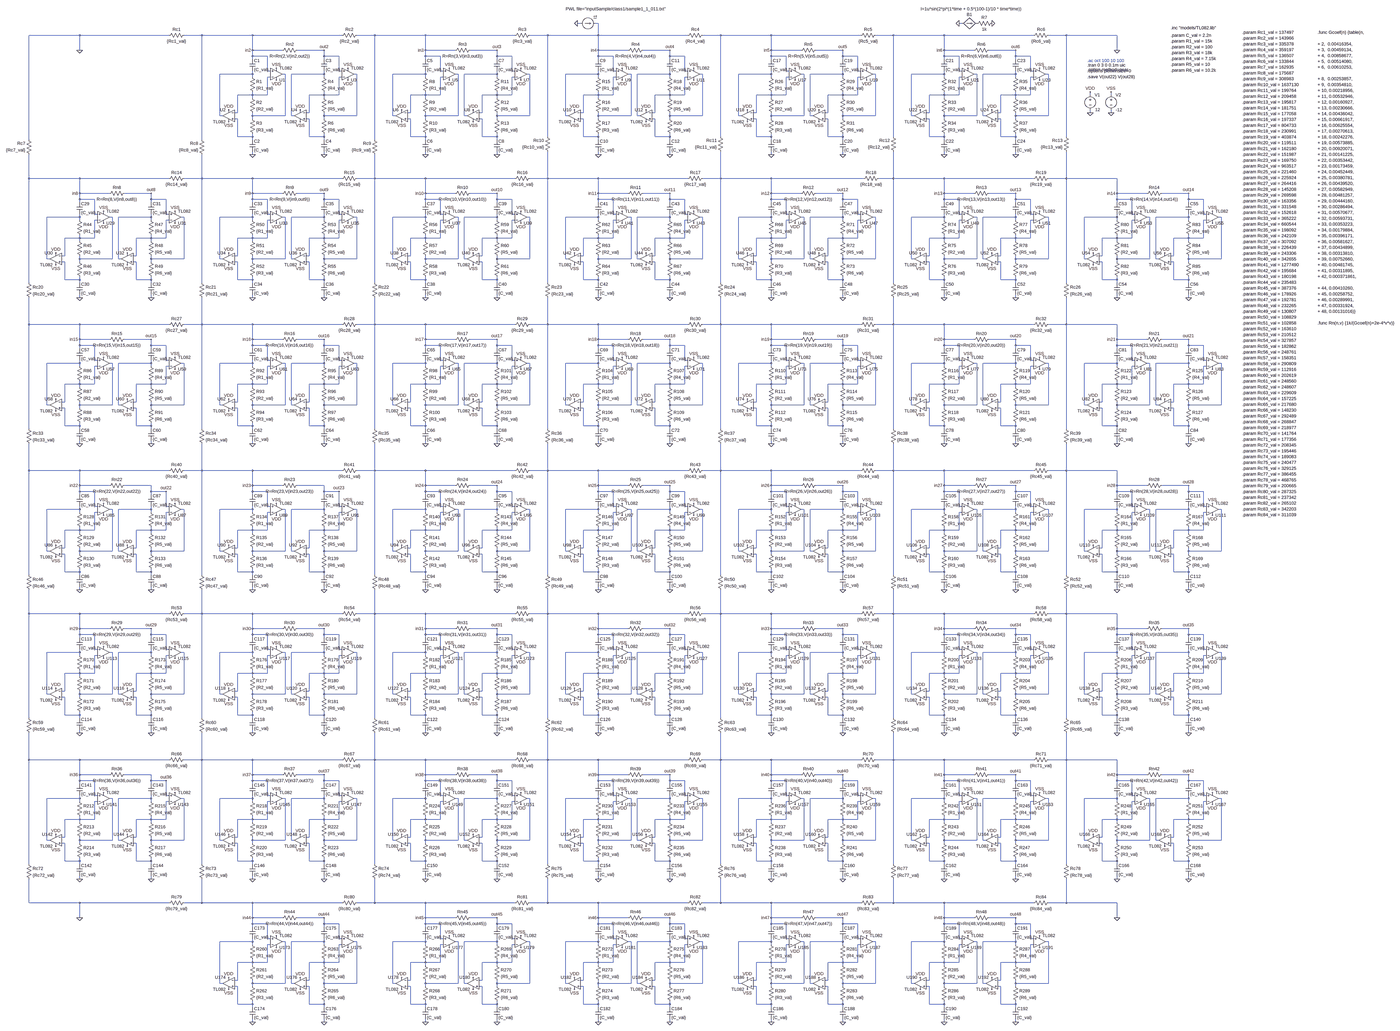
[diagram p0: schematic R2NN77TestWithoutCellTL082.asc, whole sheet]
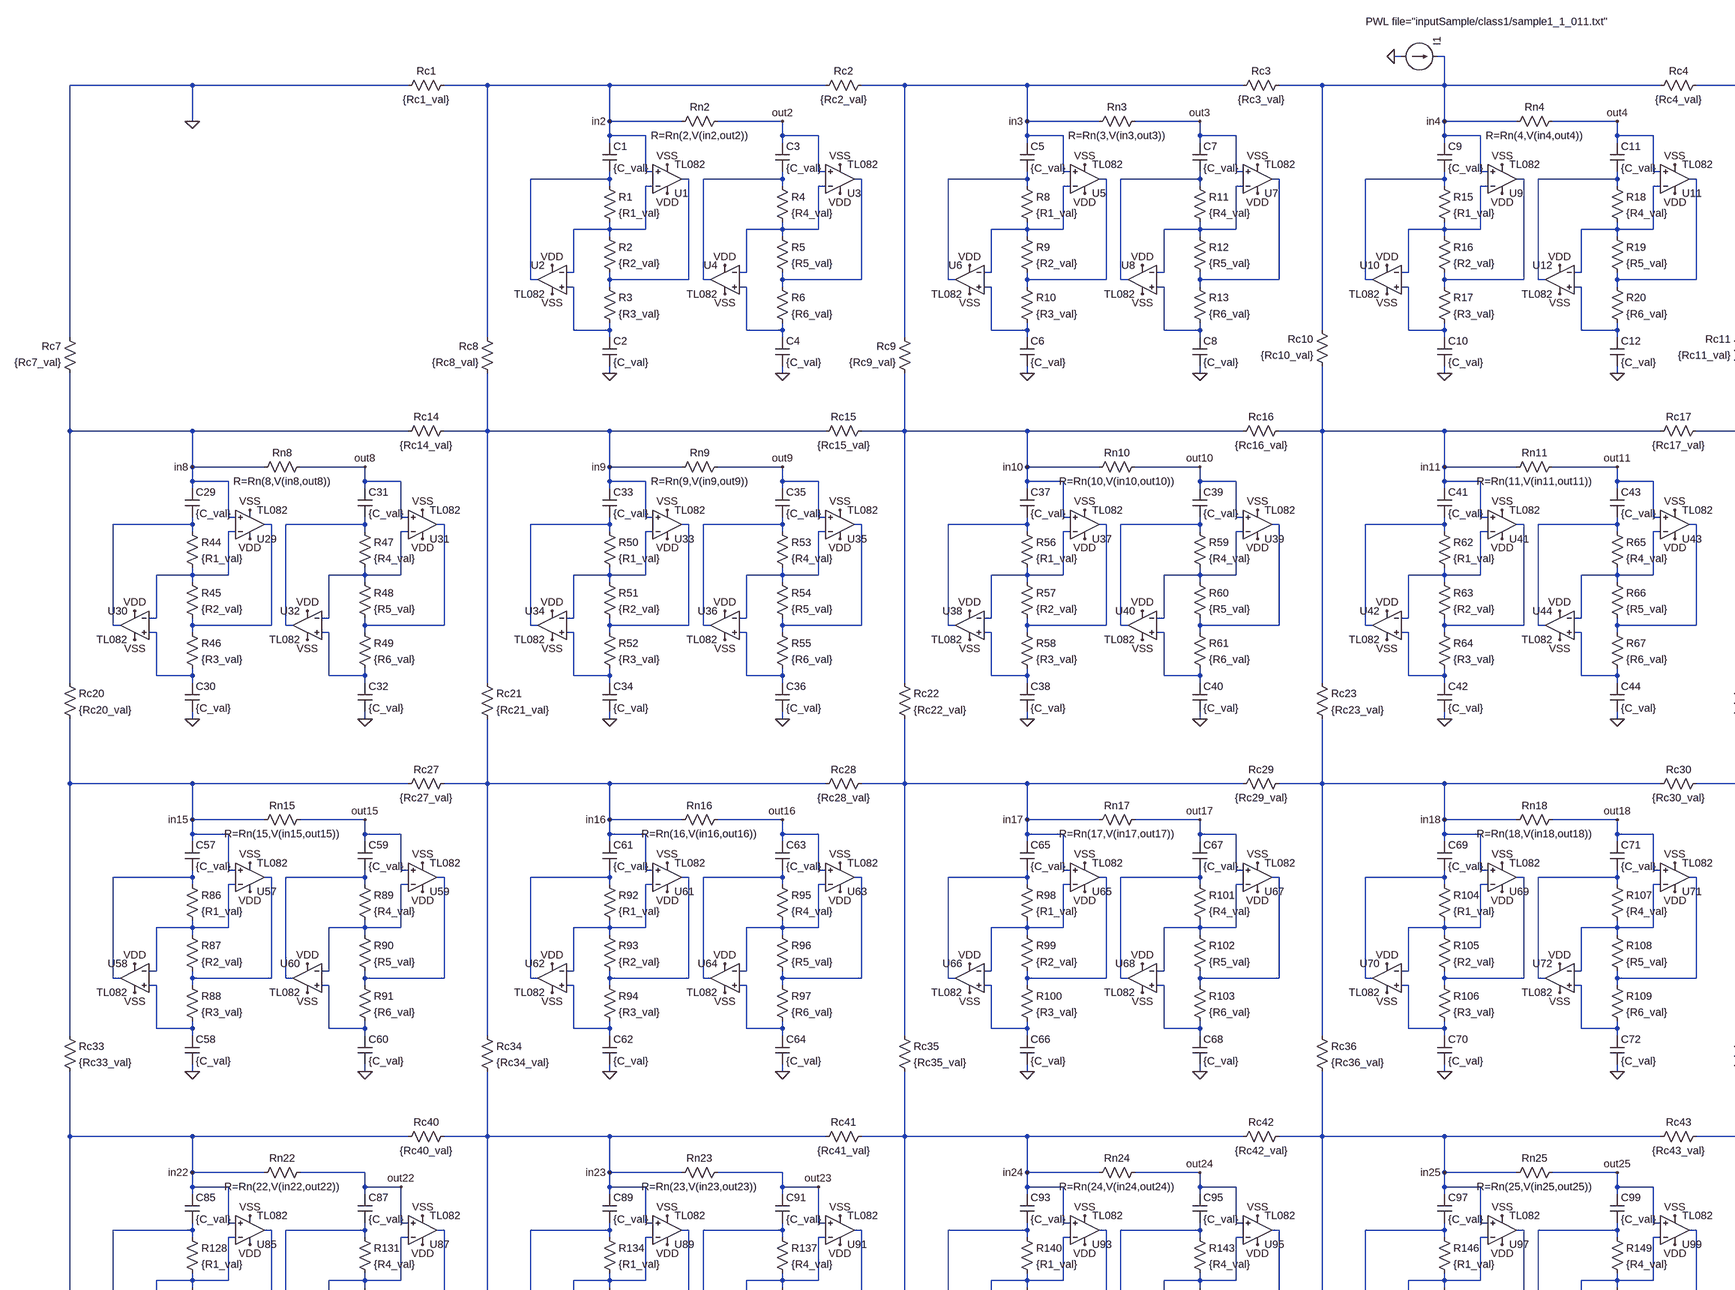
[diagram p1: schematic R2NN77TestWithoutCellTL082.asc, part, row 1 of 2, column 1 of 2]
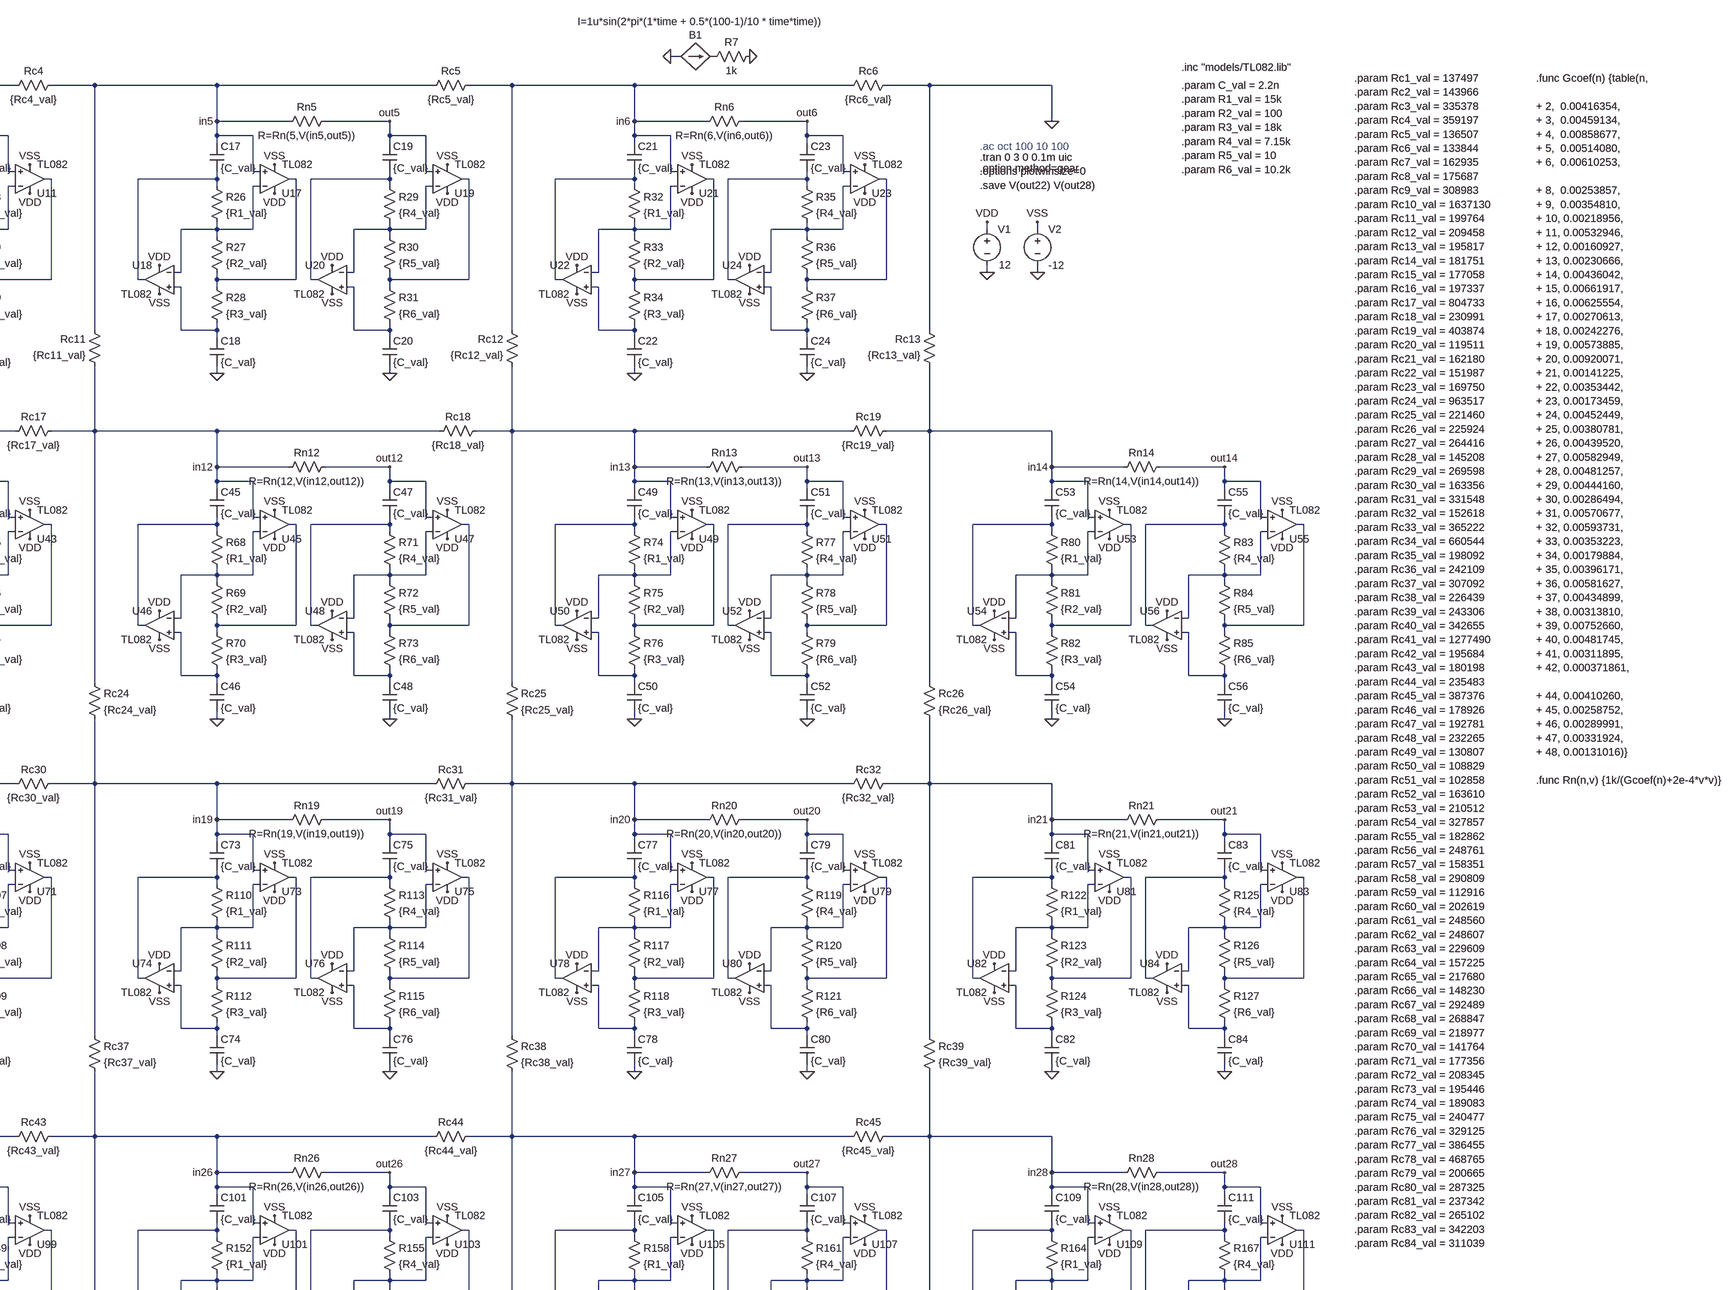
[diagram p2: schematic R2NN77TestWithoutCellTL082.asc, part, row 1 of 2, column 2 of 2]
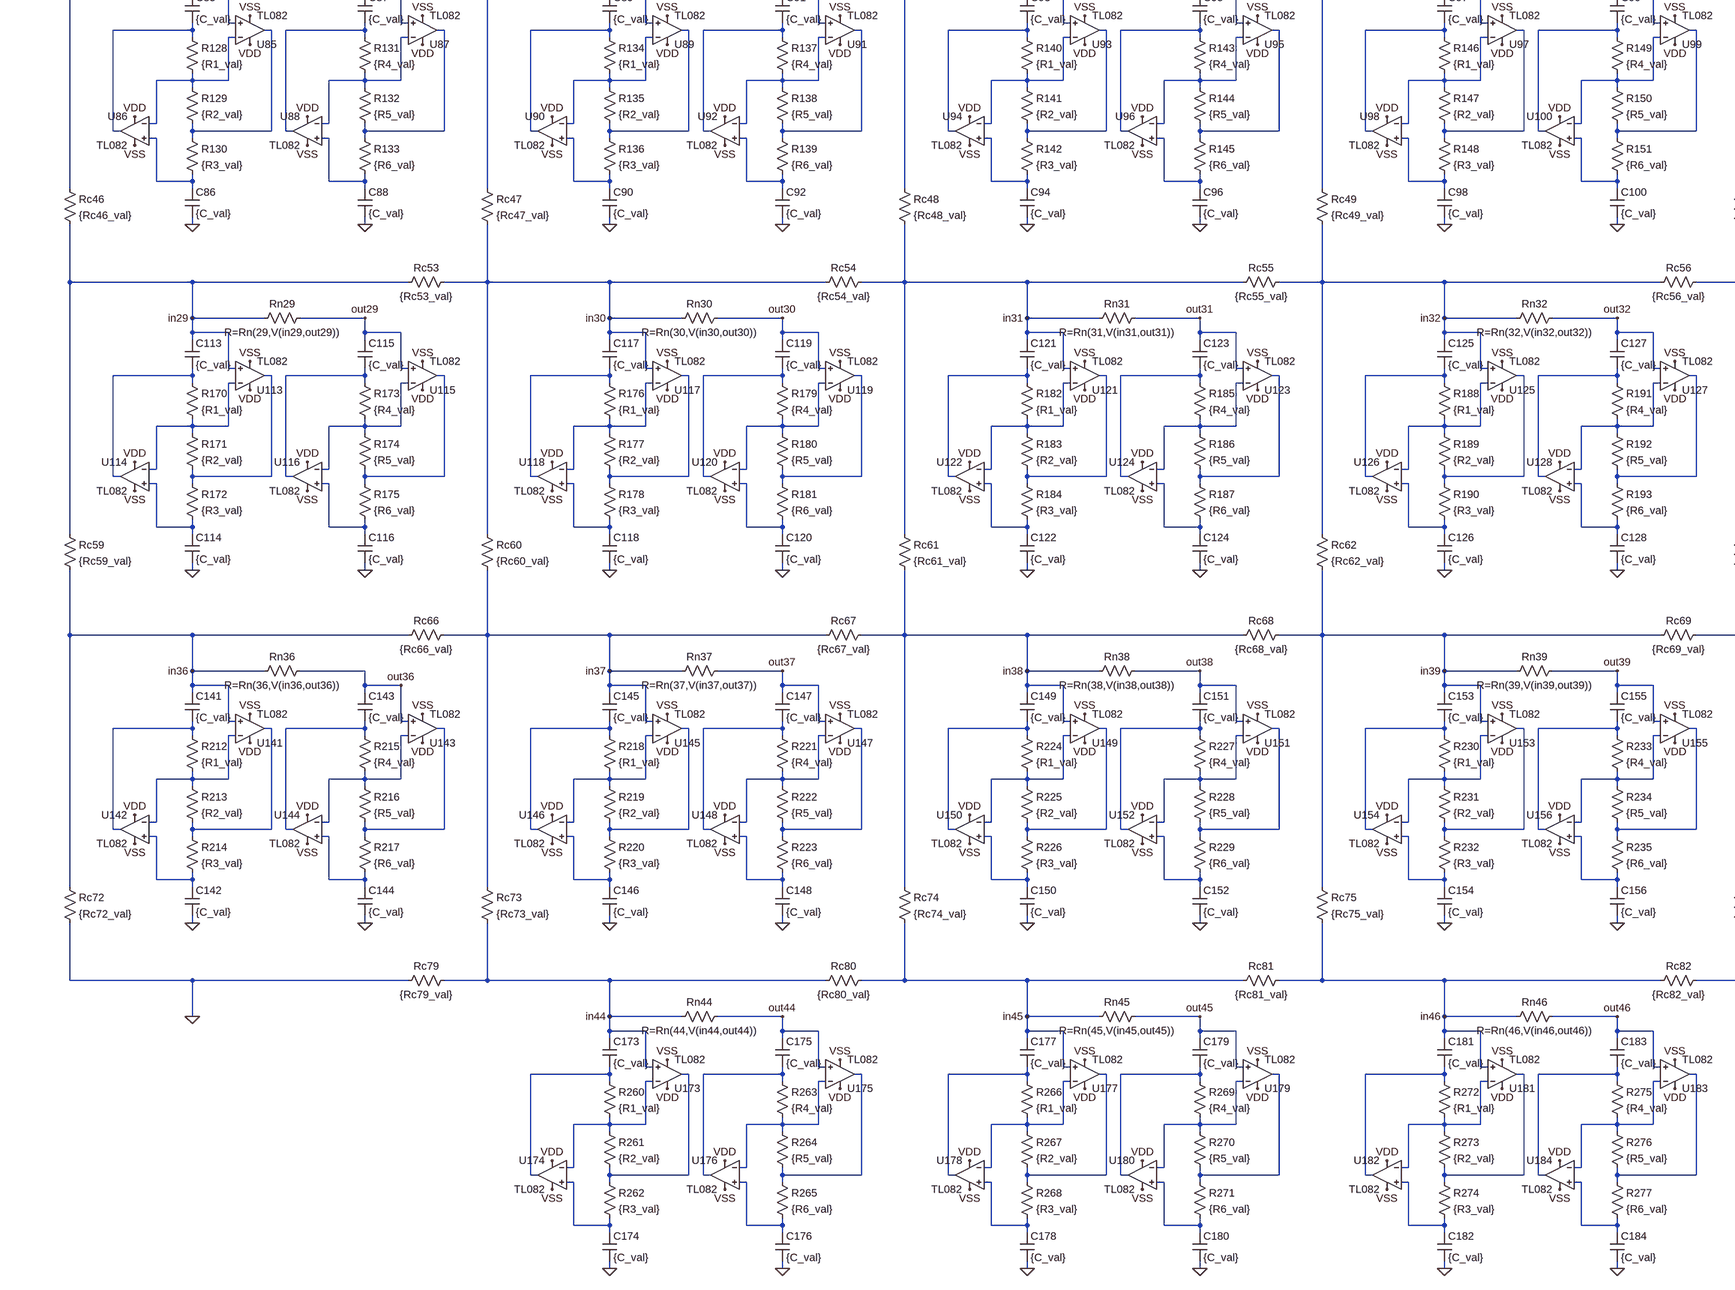
[diagram p3: schematic R2NN77TestWithoutCellTL082.asc, part, row 2 of 2, column 1 of 2]
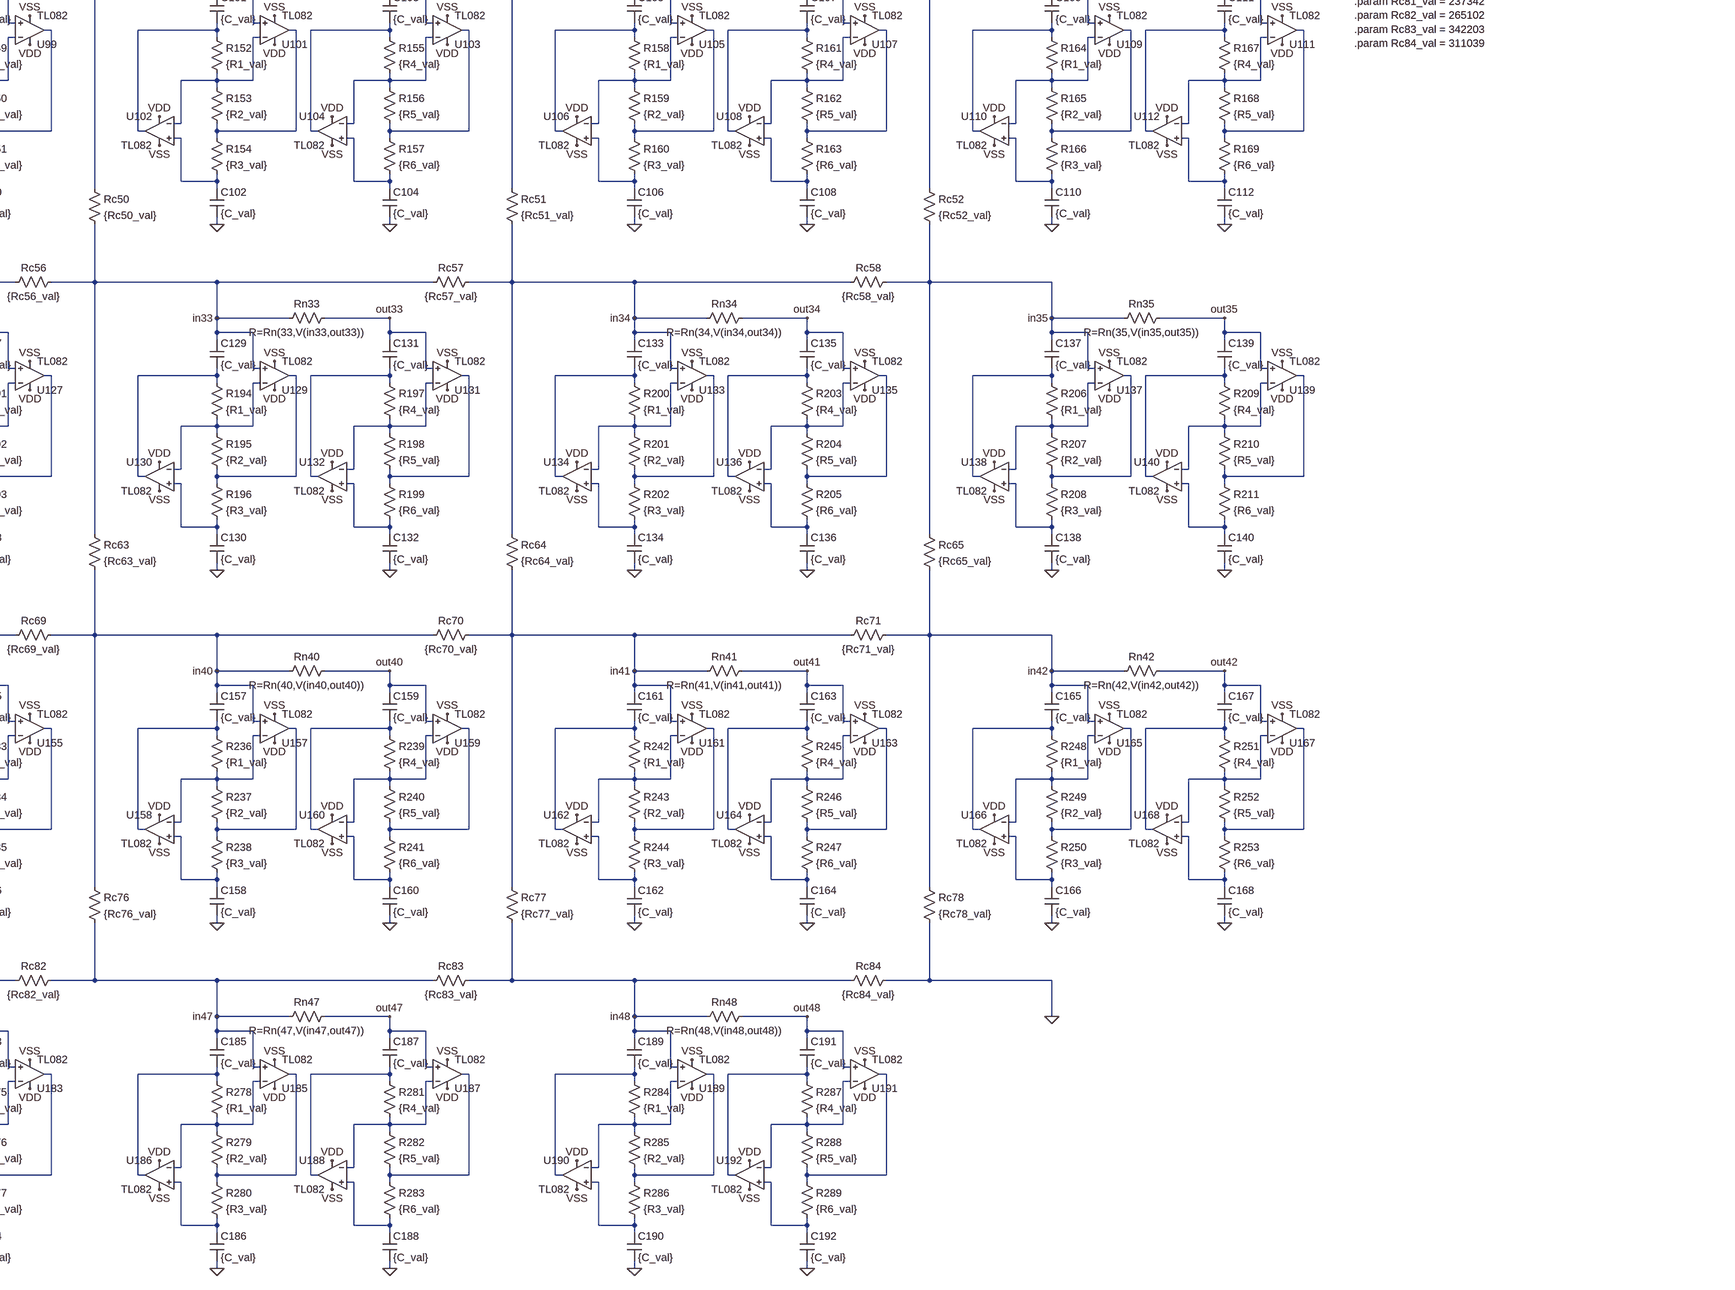
[diagram p4: schematic R2NN77TestWithoutCellTL082.asc, part, row 2 of 2, column 2 of 2]
* R2NN77TestWithoutCellTL082.asc
V1 VDD 0 12
V2 VSS 0 -12
C1 in2 N001 {C_val}
R1 N001 N021 {R1_val}
R2 N021 N002 {R2_val}
R3 N002 N031 {R3_val}
C2 N031 0 {C_val}
C3 out2 N003 {C_val}
R4 N003 N022 {R4_val}
R5 N022 N004 {R5_val}
R6 N004 N032 {R6_val}
C4 N032 0 {C_val}
Rn2 out2 in2 R=Rn(2,V(in2,out2))
C5 in3 N005 {C_val}
R8 N005 N023 {R1_val}
R9 N023 N006 {R2_val}
R10 N006 N033 {R3_val}
C6 N033 0 {C_val}
C7 out3 N007 {C_val}
R11 N007 N024 {R4_val}
R12 N024 N008 {R5_val}
R13 N008 N034 {R6_val}
C8 N034 0 {C_val}
Rn3 out3 in3 R=Rn(3,V(in3,out3))
C9 in4 N009 {C_val}
R15 N009 N025 {R1_val}
R16 N025 N010 {R2_val}
R17 N010 N035 {R3_val}
C10 N035 0 {C_val}
C11 out4 N011 {C_val}
R18 N011 N026 {R4_val}
R19 N026 N012 {R5_val}
R20 N012 N036 {R6_val}
C12 N036 0 {C_val}
Rn4 out4 in4 R=Rn(4,V(in4,out4))
Rc2 in3 in2 {Rc2_val}
Rc3 in4 in3 {Rc3_val}
Rc8 in9 in2 {Rc8_val}
Rc9 in10 in3 {Rc9_val}
Rc10 in11 in4 {Rc10_val}
Rc14 in8 in9 {Rc14_val}
Rc15 in9 in10 {Rc15_val}
Rc16 in10 in11 {Rc16_val}
Rc17 in11 in12 {Rc17_val}
Rc20 in8 in15 {Rc20_val}
Rc21 in9 in16 {Rc21_val}
Rc22 in10 in17 {Rc22_val}
Rc23 in11 in18 {Rc23_val}
Rc24 in12 in19 {Rc24_val}
Rc27 in16 in15 {Rc27_val}
Rc28 in17 in16 {Rc28_val}
Rc29 in18 in17 {Rc29_val}
Rc30 in19 in18 {Rc30_val}
Rc33 in15 in22 {Rc33_val}
Rc34 in16 in23 {Rc34_val}
Rc35 in17 in24 {Rc35_val}
Rc36 in18 in25 {Rc36_val}
Rc37 in19 in26 {Rc37_val}
Rc40 in23 in22 {Rc40_val}
Rc41 in24 in23 {Rc41_val}
Rc42 in25 in24 {Rc42_val}
Rc43 in26 in25 {Rc43_val}
Rc46 in22 in29 {Rc46_val}
Rc47 in23 in30 {Rc47_val}
Rc48 in24 in31 {Rc48_val}
Rc49 in25 in32 {Rc49_val}
Rc50 in26 in33 {Rc50_val}
Rc1 in2 0 {Rc1_val}
Rc7 in8 0 {Rc7_val}
Rc11 in12 in5 {Rc11_val}
Rc4 in4 in5 {Rc4_val}
Rc53 in30 in29 {Rc53_val}
Rc54 in31 in30 {Rc54_val}
Rc55 in32 in31 {Rc55_val}
Rc56 in33 in32 {Rc56_val}
R7 0 P001 1k
B1 0 P001 I=1u*sin(2*pi*(1*time + 0.5*(100-1)/10 * time*time))
I1 0 in4 PWL file="inputSample/class1/sample1_1_011.txt"
X§U1 in2 N021 VDD VSS N002 TL082  ; pins In+ In- V+ V- OUT
X§U2 N031 N021 VDD VSS N001 TL082  ; pins In+ In- V+ V- OUT
X§U3 out2 N022 VDD VSS N004 TL082  ; pins In+ In- V+ V- OUT
X§U4 N032 N022 VDD VSS N003 TL082  ; pins In+ In- V+ V- OUT
X§U5 in3 N023 VDD VSS N006 TL082  ; pins In+ In- V+ V- OUT
X§U6 N033 N023 VDD VSS N005 TL082  ; pins In+ In- V+ V- OUT
X§U7 out3 N024 VDD VSS N008 TL082  ; pins In+ In- V+ V- OUT
X§U8 N034 N024 VDD VSS N007 TL082  ; pins In+ In- V+ V- OUT
X§U9 in4 N025 VDD VSS N010 TL082  ; pins In+ In- V+ V- OUT
X§U10 N035 N025 VDD VSS N009 TL082  ; pins In+ In- V+ V- OUT
X§U11 out4 N026 VDD VSS N012 TL082  ; pins In+ In- V+ V- OUT
X§U12 N036 N026 VDD VSS N011 TL082  ; pins In+ In- V+ V- OUT
Rc12 in13 in6 {Rc12_val}
Rc19 in13 in14 {Rc19_val}
Rc25 in13 in20 {Rc25_val}
Rc26 in14 in21 {Rc26_val}
Rc32 in21 in20 {Rc32_val}
Rc38 in20 in27 {Rc38_val}
Rc39 in21 in28 {Rc39_val}
Rc45 in28 in27 {Rc45_val}
Rc51 in27 in34 {Rc51_val}
Rc52 in28 in35 {Rc52_val}
Rc13 in14 0 {Rc13_val}
Rc6 in6 0 {Rc6_val}
Rc58 in35 in34 {Rc58_val}
Rc5 in5 in6 {Rc5_val}
Rc18 in12 in13 {Rc18_val}
Rc31 in19 in20 {Rc31_val}
Rc44 in26 in27 {Rc44_val}
Rc57 in33 in34 {Rc57_val}
Rc59 in29 in36 {Rc59_val}
Rc60 in30 in37 {Rc60_val}
Rc61 in31 in38 {Rc61_val}
Rc62 in32 in39 {Rc62_val}
Rc63 in33 in40 {Rc63_val}
Rc66 in37 in36 {Rc66_val}
Rc67 in38 in37 {Rc67_val}
Rc68 in39 in38 {Rc68_val}
Rc69 in40 in39 {Rc69_val}
Rc72 in36 0 {Rc72_val}
Rc73 in37 in44 {Rc73_val}
Rc74 in38 in45 {Rc74_val}
Rc75 in39 in46 {Rc75_val}
Rc76 in40 in47 {Rc76_val}
Rc79 in44 0 {Rc79_val}
Rc80 in45 in44 {Rc80_val}
Rc81 in46 in45 {Rc81_val}
Rc82 in47 in46 {Rc82_val}
Rc64 in34 in41 {Rc64_val}
Rc65 in35 in42 {Rc65_val}
Rc71 in42 in41 {Rc71_val}
Rc77 in41 in48 {Rc77_val}
Rc78 in42 0 {Rc78_val}
Rc84 0 in48 {Rc84_val}
Rc70 in40 in41 {Rc70_val}
Rc83 in47 in48 {Rc83_val}
C17 in5 N013 {C_val}
R26 N013 N027 {R1_val}
R27 N027 N014 {R2_val}
R28 N014 N037 {R3_val}
C18 N037 0 {C_val}
C19 out5 N015 {C_val}
R29 N015 N028 {R4_val}
R30 N028 N016 {R5_val}
R31 N016 N038 {R6_val}
C20 N038 0 {C_val}
Rn5 out5 in5 R=Rn(5,V(in5,out5))
X§U17 in5 N027 VDD VSS N014 TL082  ; pins In+ In- V+ V- OUT
X§U18 N037 N027 VDD VSS N013 TL082  ; pins In+ In- V+ V- OUT
X§U19 out5 N028 VDD VSS N016 TL082  ; pins In+ In- V+ V- OUT
X§U20 N038 N028 VDD VSS N015 TL082  ; pins In+ In- V+ V- OUT
C21 in6 N017 {C_val}
R32 N017 N029 {R1_val}
R33 N029 N018 {R2_val}
R34 N018 N039 {R3_val}
C22 N039 0 {C_val}
C23 out6 N019 {C_val}
R35 N019 N030 {R4_val}
R36 N030 N020 {R5_val}
R37 N020 N040 {R6_val}
C24 N040 0 {C_val}
Rn6 out6 in6 R=Rn(6,V(in6,out6))
X§U21 in6 N029 VDD VSS N018 TL082  ; pins In+ In- V+ V- OUT
X§U22 N039 N029 VDD VSS N017 TL082  ; pins In+ In- V+ V- OUT
X§U23 out6 N030 VDD VSS N020 TL082  ; pins In+ In- V+ V- OUT
X§U24 N040 N030 VDD VSS N019 TL082  ; pins In+ In- V+ V- OUT
C29 in8 N041 {C_val}
R44 N041 N069 {R1_val}
R45 N069 N042 {R2_val}
R46 N042 N083 {R3_val}
C30 N083 0 {C_val}
C31 out8 N043 {C_val}
R47 N043 N070 {R4_val}
R48 N070 N044 {R5_val}
R49 N044 N084 {R6_val}
C32 N084 0 {C_val}
Rn8 out8 in8 R=Rn(8,V(in8,out8))
X§U29 in8 N069 VDD VSS N042 TL082  ; pins In+ In- V+ V- OUT
X§U30 N083 N069 VDD VSS N041 TL082  ; pins In+ In- V+ V- OUT
X§U31 out8 N070 VDD VSS N044 TL082  ; pins In+ In- V+ V- OUT
X§U32 N084 N070 VDD VSS N043 TL082  ; pins In+ In- V+ V- OUT
C33 in9 N045 {C_val}
R50 N045 N071 {R1_val}
R51 N071 N046 {R2_val}
R52 N046 N085 {R3_val}
C34 N085 0 {C_val}
C35 out9 N047 {C_val}
R53 N047 N072 {R4_val}
R54 N072 N048 {R5_val}
R55 N048 N086 {R6_val}
C36 N086 0 {C_val}
Rn9 out9 in9 R=Rn(9,V(in9,out9))
X§U33 in9 N071 VDD VSS N046 TL082  ; pins In+ In- V+ V- OUT
X§U34 N085 N071 VDD VSS N045 TL082  ; pins In+ In- V+ V- OUT
X§U35 out9 N072 VDD VSS N048 TL082  ; pins In+ In- V+ V- OUT
X§U36 N086 N072 VDD VSS N047 TL082  ; pins In+ In- V+ V- OUT
C37 in10 N049 {C_val}
R56 N049 N073 {R1_val}
R57 N073 N050 {R2_val}
R58 N050 N087 {R3_val}
C38 N087 0 {C_val}
C39 out10 N051 {C_val}
R59 N051 N074 {R4_val}
R60 N074 N052 {R5_val}
R61 N052 N088 {R6_val}
C40 N088 0 {C_val}
Rn10 out10 in10 R=Rn(10,V(in10,out10))
X§U37 in10 N073 VDD VSS N050 TL082  ; pins In+ In- V+ V- OUT
X§U38 N087 N073 VDD VSS N049 TL082  ; pins In+ In- V+ V- OUT
X§U39 out10 N074 VDD VSS N052 TL082  ; pins In+ In- V+ V- OUT
X§U40 N088 N074 VDD VSS N051 TL082  ; pins In+ In- V+ V- OUT
C41 in11 N053 {C_val}
R62 N053 N075 {R1_val}
R63 N075 N054 {R2_val}
R64 N054 N089 {R3_val}
C42 N089 0 {C_val}
C43 out11 N055 {C_val}
R65 N055 N076 {R4_val}
R66 N076 N056 {R5_val}
R67 N056 N090 {R6_val}
C44 N090 0 {C_val}
Rn11 out11 in11 R=Rn(11,V(in11,out11))
X§U41 in11 N075 VDD VSS N054 TL082  ; pins In+ In- V+ V- OUT
X§U42 N089 N075 VDD VSS N053 TL082  ; pins In+ In- V+ V- OUT
X§U43 out11 N076 VDD VSS N056 TL082  ; pins In+ In- V+ V- OUT
X§U44 N090 N076 VDD VSS N055 TL082  ; pins In+ In- V+ V- OUT
C45 in12 N057 {C_val}
R68 N057 N077 {R1_val}
R69 N077 N058 {R2_val}
R70 N058 N091 {R3_val}
C46 N091 0 {C_val}
C47 out12 N059 {C_val}
R71 N059 N078 {R4_val}
R72 N078 N060 {R5_val}
R73 N060 N092 {R6_val}
C48 N092 0 {C_val}
Rn12 out12 in12 R=Rn(12,V(in12,out12))
X§U45 in12 N077 VDD VSS N058 TL082  ; pins In+ In- V+ V- OUT
X§U46 N091 N077 VDD VSS N057 TL082  ; pins In+ In- V+ V- OUT
X§U47 out12 N078 VDD VSS N060 TL082  ; pins In+ In- V+ V- OUT
X§U48 N092 N078 VDD VSS N059 TL082  ; pins In+ In- V+ V- OUT
C49 in13 N061 {C_val}
R74 N061 N079 {R1_val}
R75 N079 N062 {R2_val}
R76 N062 N093 {R3_val}
C50 N093 0 {C_val}
C51 out13 N063 {C_val}
R77 N063 N080 {R4_val}
R78 N080 N064 {R5_val}
R79 N064 N094 {R6_val}
C52 N094 0 {C_val}
Rn13 out13 in13 R=Rn(13,V(in13,out13))
X§U49 in13 N079 VDD VSS N062 TL082  ; pins In+ In- V+ V- OUT
X§U50 N093 N079 VDD VSS N061 TL082  ; pins In+ In- V+ V- OUT
X§U51 out13 N080 VDD VSS N064 TL082  ; pins In+ In- V+ V- OUT
X§U52 N094 N080 VDD VSS N063 TL082  ; pins In+ In- V+ V- OUT
C53 in14 N065 {C_val}
R80 N065 N081 {R1_val}
R81 N081 N066 {R2_val}
R82 N066 N095 {R3_val}
C54 N095 0 {C_val}
C55 out14 N067 {C_val}
R83 N067 N082 {R4_val}
R84 N082 N068 {R5_val}
R85 N068 N096 {R6_val}
C56 N096 0 {C_val}
Rn14 out14 in14 R=Rn(14,V(in14,out14))
X§U53 in14 N081 VDD VSS N066 TL082  ; pins In+ In- V+ V- OUT
X§U54 N095 N081 VDD VSS N065 TL082  ; pins In+ In- V+ V- OUT
X§U55 out14 N082 VDD VSS N068 TL082  ; pins In+ In- V+ V- OUT
X§U56 N096 N082 VDD VSS N067 TL082  ; pins In+ In- V+ V- OUT
C57 in15 N097 {C_val}
R86 N097 N125 {R1_val}
R87 N125 N098 {R2_val}
R88 N098 N139 {R3_val}
C58 N139 0 {C_val}
C59 out15 N099 {C_val}
R89 N099 N126 {R4_val}
R90 N126 N100 {R5_val}
R91 N100 N140 {R6_val}
C60 N140 0 {C_val}
Rn15 out15 in15 R=Rn(15,V(in15,out15))
X§U57 in15 N125 VDD VSS N098 TL082  ; pins In+ In- V+ V- OUT
X§U58 N139 N125 VDD VSS N097 TL082  ; pins In+ In- V+ V- OUT
X§U59 out15 N126 VDD VSS N100 TL082  ; pins In+ In- V+ V- OUT
X§U60 N140 N126 VDD VSS N099 TL082  ; pins In+ In- V+ V- OUT
C61 in16 N101 {C_val}
R92 N101 N127 {R1_val}
R93 N127 N102 {R2_val}
R94 N102 N141 {R3_val}
C62 N141 0 {C_val}
C63 out16 N103 {C_val}
R95 N103 N128 {R4_val}
R96 N128 N104 {R5_val}
R97 N104 N142 {R6_val}
C64 N142 0 {C_val}
Rn16 out16 in16 R=Rn(16,V(in16,out16))
X§U61 in16 N127 VDD VSS N102 TL082  ; pins In+ In- V+ V- OUT
X§U62 N141 N127 VDD VSS N101 TL082  ; pins In+ In- V+ V- OUT
X§U63 out16 N128 VDD VSS N104 TL082  ; pins In+ In- V+ V- OUT
X§U64 N142 N128 VDD VSS N103 TL082  ; pins In+ In- V+ V- OUT
C65 in17 N105 {C_val}
R98 N105 N129 {R1_val}
R99 N129 N106 {R2_val}
R100 N106 N143 {R3_val}
C66 N143 0 {C_val}
C67 out17 N107 {C_val}
R101 N107 N130 {R4_val}
R102 N130 N108 {R5_val}
R103 N108 N144 {R6_val}
C68 N144 0 {C_val}
Rn17 out17 in17 R=Rn(17,V(in17,out17))
X§U65 in17 N129 VDD VSS N106 TL082  ; pins In+ In- V+ V- OUT
X§U66 N143 N129 VDD VSS N105 TL082  ; pins In+ In- V+ V- OUT
X§U67 out17 N130 VDD VSS N108 TL082  ; pins In+ In- V+ V- OUT
X§U68 N144 N130 VDD VSS N107 TL082  ; pins In+ In- V+ V- OUT
C69 in18 N109 {C_val}
R104 N109 N131 {R1_val}
R105 N131 N110 {R2_val}
R106 N110 N145 {R3_val}
C70 N145 0 {C_val}
C71 out18 N111 {C_val}
R107 N111 N132 {R4_val}
R108 N132 N112 {R5_val}
R109 N112 N146 {R6_val}
C72 N146 0 {C_val}
Rn18 out18 in18 R=Rn(18,V(in18,out18))
X§U69 in18 N131 VDD VSS N110 TL082  ; pins In+ In- V+ V- OUT
X§U70 N145 N131 VDD VSS N109 TL082  ; pins In+ In- V+ V- OUT
X§U71 out18 N132 VDD VSS N112 TL082  ; pins In+ In- V+ V- OUT
X§U72 N146 N132 VDD VSS N111 TL082  ; pins In+ In- V+ V- OUT
C73 in19 N113 {C_val}
R110 N113 N133 {R1_val}
R111 N133 N114 {R2_val}
R112 N114 N147 {R3_val}
C74 N147 0 {C_val}
C75 out19 N115 {C_val}
R113 N115 N134 {R4_val}
R114 N134 N116 {R5_val}
R115 N116 N148 {R6_val}
C76 N148 0 {C_val}
Rn19 out19 in19 R=Rn(19,V(in19,out19))
X§U73 in19 N133 VDD VSS N114 TL082  ; pins In+ In- V+ V- OUT
X§U74 N147 N133 VDD VSS N113 TL082  ; pins In+ In- V+ V- OUT
X§U75 out19 N134 VDD VSS N116 TL082  ; pins In+ In- V+ V- OUT
X§U76 N148 N134 VDD VSS N115 TL082  ; pins In+ In- V+ V- OUT
C77 in20 N117 {C_val}
R116 N117 N135 {R1_val}
R117 N135 N118 {R2_val}
R118 N118 N149 {R3_val}
C78 N149 0 {C_val}
C79 out20 N119 {C_val}
R119 N119 N136 {R4_val}
R120 N136 N120 {R5_val}
R121 N120 N150 {R6_val}
C80 N150 0 {C_val}
Rn20 out20 in20 R=Rn(20,V(in20,out20))
X§U77 in20 N135 VDD VSS N118 TL082  ; pins In+ In- V+ V- OUT
X§U78 N149 N135 VDD VSS N117 TL082  ; pins In+ In- V+ V- OUT
X§U79 out20 N136 VDD VSS N120 TL082  ; pins In+ In- V+ V- OUT
X§U80 N150 N136 VDD VSS N119 TL082  ; pins In+ In- V+ V- OUT
C81 in21 N121 {C_val}
R122 N121 N137 {R1_val}
R123 N137 N122 {R2_val}
R124 N122 N151 {R3_val}
C82 N151 0 {C_val}
C83 out21 N123 {C_val}
R125 N123 N138 {R4_val}
R126 N138 N124 {R5_val}
R127 N124 N152 {R6_val}
C84 N152 0 {C_val}
Rn21 out21 in21 R=Rn(21,V(in21,out21))
X§U81 in21 N137 VDD VSS N122 TL082  ; pins In+ In- V+ V- OUT
X§U82 N151 N137 VDD VSS N121 TL082  ; pins In+ In- V+ V- OUT
X§U83 out21 N138 VDD VSS N124 TL082  ; pins In+ In- V+ V- OUT
X§U84 N152 N138 VDD VSS N123 TL082  ; pins In+ In- V+ V- OUT
C85 in22 N153 {C_val}
R128 N153 N181 {R1_val}
R129 N181 N154 {R2_val}
R130 N154 N195 {R3_val}
C86 N195 0 {C_val}
C87 out22 N155 {C_val}
R131 N155 N182 {R4_val}
R132 N182 N156 {R5_val}
R133 N156 N196 {R6_val}
C88 N196 0 {C_val}
Rn22 out22 in22 R=Rn(22,V(in22,out22))
X§U85 in22 N181 VDD VSS N154 TL082  ; pins In+ In- V+ V- OUT
X§U86 N195 N181 VDD VSS N153 TL082  ; pins In+ In- V+ V- OUT
X§U87 out22 N182 VDD VSS N156 TL082  ; pins In+ In- V+ V- OUT
X§U88 N196 N182 VDD VSS N155 TL082  ; pins In+ In- V+ V- OUT
C89 in23 N157 {C_val}
R134 N157 N183 {R1_val}
R135 N183 N158 {R2_val}
R136 N158 N197 {R3_val}
C90 N197 0 {C_val}
C91 out23 N159 {C_val}
R137 N159 N184 {R4_val}
R138 N184 N160 {R5_val}
R139 N160 N198 {R6_val}
C92 N198 0 {C_val}
Rn23 out23 in23 R=Rn(23,V(in23,out23))
X§U89 in23 N183 VDD VSS N158 TL082  ; pins In+ In- V+ V- OUT
X§U90 N197 N183 VDD VSS N157 TL082  ; pins In+ In- V+ V- OUT
X§U91 out23 N184 VDD VSS N160 TL082  ; pins In+ In- V+ V- OUT
X§U92 N198 N184 VDD VSS N159 TL082  ; pins In+ In- V+ V- OUT
C93 in24 N161 {C_val}
R140 N161 N185 {R1_val}
R141 N185 N162 {R2_val}
R142 N162 N199 {R3_val}
C94 N199 0 {C_val}
C95 out24 N163 {C_val}
R143 N163 N186 {R4_val}
R144 N186 N164 {R5_val}
R145 N164 N200 {R6_val}
C96 N200 0 {C_val}
Rn24 out24 in24 R=Rn(24,V(in24,out24))
X§U93 in24 N185 VDD VSS N162 TL082  ; pins In+ In- V+ V- OUT
X§U94 N199 N185 VDD VSS N161 TL082  ; pins In+ In- V+ V- OUT
X§U95 out24 N186 VDD VSS N164 TL082  ; pins In+ In- V+ V- OUT
X§U96 N200 N186 VDD VSS N163 TL082  ; pins In+ In- V+ V- OUT
C97 in25 N165 {C_val}
R146 N165 N187 {R1_val}
R147 N187 N166 {R2_val}
R148 N166 N201 {R3_val}
C98 N201 0 {C_val}
C99 out25 N167 {C_val}
R149 N167 N188 {R4_val}
R150 N188 N168 {R5_val}
R151 N168 N202 {R6_val}
C100 N202 0 {C_val}
Rn25 out25 in25 R=Rn(25,V(in25,out25))
X§U97 in25 N187 VDD VSS N166 TL082  ; pins In+ In- V+ V- OUT
X§U98 N201 N187 VDD VSS N165 TL082  ; pins In+ In- V+ V- OUT
X§U99 out25 N188 VDD VSS N168 TL082  ; pins In+ In- V+ V- OUT
X§U100 N202 N188 VDD VSS N167 TL082  ; pins In+ In- V+ V- OUT
C101 in26 N169 {C_val}
R152 N169 N189 {R1_val}
R153 N189 N170 {R2_val}
R154 N170 N203 {R3_val}
C102 N203 0 {C_val}
C103 out26 N171 {C_val}
R155 N171 N190 {R4_val}
R156 N190 N172 {R5_val}
R157 N172 N204 {R6_val}
C104 N204 0 {C_val}
Rn26 out26 in26 R=Rn(26,V(in26,out26))
X§U101 in26 N189 VDD VSS N170 TL082  ; pins In+ In- V+ V- OUT
X§U102 N203 N189 VDD VSS N169 TL082  ; pins In+ In- V+ V- OUT
X§U103 out26 N190 VDD VSS N172 TL082  ; pins In+ In- V+ V- OUT
X§U104 N204 N190 VDD VSS N171 TL082  ; pins In+ In- V+ V- OUT
C105 in27 N173 {C_val}
R158 N173 N191 {R1_val}
R159 N191 N174 {R2_val}
R160 N174 N205 {R3_val}
C106 N205 0 {C_val}
C107 out27 N175 {C_val}
R161 N175 N192 {R4_val}
R162 N192 N176 {R5_val}
R163 N176 N206 {R6_val}
C108 N206 0 {C_val}
Rn27 out27 in27 R=Rn(27,V(in27,out27))
X§U105 in27 N191 VDD VSS N174 TL082  ; pins In+ In- V+ V- OUT
X§U106 N205 N191 VDD VSS N173 TL082  ; pins In+ In- V+ V- OUT
X§U107 out27 N192 VDD VSS N176 TL082  ; pins In+ In- V+ V- OUT
X§U108 N206 N192 VDD VSS N175 TL082  ; pins In+ In- V+ V- OUT
C109 in28 N177 {C_val}
R164 N177 N193 {R1_val}
R165 N193 N178 {R2_val}
R166 N178 N207 {R3_val}
C110 N207 0 {C_val}
C111 out28 N179 {C_val}
R167 N179 N194 {R4_val}
R168 N194 N180 {R5_val}
R169 N180 N208 {R6_val}
C112 N208 0 {C_val}
Rn28 out28 in28 R=Rn(28,V(in28,out28))
X§U109 in28 N193 VDD VSS N178 TL082  ; pins In+ In- V+ V- OUT
X§U110 N207 N193 VDD VSS N177 TL082  ; pins In+ In- V+ V- OUT
X§U111 out28 N194 VDD VSS N180 TL082  ; pins In+ In- V+ V- OUT
X§U112 N208 N194 VDD VSS N179 TL082  ; pins In+ In- V+ V- OUT
C113 in29 N209 {C_val}
R170 N209 N237 {R1_val}
R171 N237 N210 {R2_val}
R172 N210 N251 {R3_val}
C114 N251 0 {C_val}
C115 out29 N211 {C_val}
R173 N211 N238 {R4_val}
R174 N238 N212 {R5_val}
R175 N212 N252 {R6_val}
C116 N252 0 {C_val}
Rn29 out29 in29 R=Rn(29,V(in29,out29))
X§U113 in29 N237 VDD VSS N210 TL082  ; pins In+ In- V+ V- OUT
X§U114 N251 N237 VDD VSS N209 TL082  ; pins In+ In- V+ V- OUT
X§U115 out29 N238 VDD VSS N212 TL082  ; pins In+ In- V+ V- OUT
X§U116 N252 N238 VDD VSS N211 TL082  ; pins In+ In- V+ V- OUT
C117 in30 N213 {C_val}
R176 N213 N239 {R1_val}
R177 N239 N214 {R2_val}
R178 N214 N253 {R3_val}
C118 N253 0 {C_val}
C119 out30 N215 {C_val}
R179 N215 N240 {R4_val}
R180 N240 N216 {R5_val}
R181 N216 N254 {R6_val}
C120 N254 0 {C_val}
Rn30 out30 in30 R=Rn(30,V(in30,out30))
X§U117 in30 N239 VDD VSS N214 TL082  ; pins In+ In- V+ V- OUT
X§U118 N253 N239 VDD VSS N213 TL082  ; pins In+ In- V+ V- OUT
X§U119 out30 N240 VDD VSS N216 TL082  ; pins In+ In- V+ V- OUT
X§U120 N254 N240 VDD VSS N215 TL082  ; pins In+ In- V+ V- OUT
C121 in31 N217 {C_val}
R182 N217 N241 {R1_val}
R183 N241 N218 {R2_val}
R184 N218 N255 {R3_val}
C122 N255 0 {C_val}
C123 out31 N219 {C_val}
R185 N219 N242 {R4_val}
R186 N242 N220 {R5_val}
R187 N220 N256 {R6_val}
C124 N256 0 {C_val}
Rn31 out31 in31 R=Rn(31,V(in31,out31))
X§U121 in31 N241 VDD VSS N218 TL082  ; pins In+ In- V+ V- OUT
X§U122 N255 N241 VDD VSS N217 TL082  ; pins In+ In- V+ V- OUT
X§U123 out31 N242 VDD VSS N220 TL082  ; pins In+ In- V+ V- OUT
X§U124 N256 N242 VDD VSS N219 TL082  ; pins In+ In- V+ V- OUT
C125 in32 N221 {C_val}
R188 N221 N243 {R1_val}
R189 N243 N222 {R2_val}
R190 N222 N257 {R3_val}
C126 N257 0 {C_val}
C127 out32 N223 {C_val}
R191 N223 N244 {R4_val}
R192 N244 N224 {R5_val}
R193 N224 N258 {R6_val}
C128 N258 0 {C_val}
Rn32 out32 in32 R=Rn(32,V(in32,out32))
X§U125 in32 N243 VDD VSS N222 TL082  ; pins In+ In- V+ V- OUT
X§U126 N257 N243 VDD VSS N221 TL082  ; pins In+ In- V+ V- OUT
X§U127 out32 N244 VDD VSS N224 TL082  ; pins In+ In- V+ V- OUT
X§U128 N258 N244 VDD VSS N223 TL082  ; pins In+ In- V+ V- OUT
C129 in33 N225 {C_val}
R194 N225 N245 {R1_val}
R195 N245 N226 {R2_val}
R196 N226 N259 {R3_val}
C130 N259 0 {C_val}
C131 out33 N227 {C_val}
R197 N227 N246 {R4_val}
R198 N246 N228 {R5_val}
R199 N228 N260 {R6_val}
C132 N260 0 {C_val}
Rn33 out33 in33 R=Rn(33,V(in33,out33))
X§U129 in33 N245 VDD VSS N226 TL082  ; pins In+ In- V+ V- OUT
X§U130 N259 N245 VDD VSS N225 TL082  ; pins In+ In- V+ V- OUT
X§U131 out33 N246 VDD VSS N228 TL082  ; pins In+ In- V+ V- OUT
X§U132 N260 N246 VDD VSS N227 TL082  ; pins In+ In- V+ V- OUT
C133 in34 N229 {C_val}
R200 N229 N247 {R1_val}
R201 N247 N230 {R2_val}
R202 N230 N261 {R3_val}
C134 N261 0 {C_val}
C135 out34 N231 {C_val}
R203 N231 N248 {R4_val}
R204 N248 N232 {R5_val}
R205 N232 N262 {R6_val}
C136 N262 0 {C_val}
Rn34 out34 in34 R=Rn(34,V(in34,out34))
X§U133 in34 N247 VDD VSS N230 TL082  ; pins In+ In- V+ V- OUT
X§U134 N261 N247 VDD VSS N229 TL082  ; pins In+ In- V+ V- OUT
X§U135 out34 N248 VDD VSS N232 TL082  ; pins In+ In- V+ V- OUT
X§U136 N262 N248 VDD VSS N231 TL082  ; pins In+ In- V+ V- OUT
C137 in35 N233 {C_val}
R206 N233 N249 {R1_val}
R207 N249 N234 {R2_val}
R208 N234 N263 {R3_val}
C138 N263 0 {C_val}
C139 out35 N235 {C_val}
R209 N235 N250 {R4_val}
R210 N250 N236 {R5_val}
R211 N236 N264 {R6_val}
C140 N264 0 {C_val}
Rn35 out35 in35 R=Rn(35,V(in35,out35))
X§U137 in35 N249 VDD VSS N234 TL082  ; pins In+ In- V+ V- OUT
X§U138 N263 N249 VDD VSS N233 TL082  ; pins In+ In- V+ V- OUT
X§U139 out35 N250 VDD VSS N236 TL082  ; pins In+ In- V+ V- OUT
X§U140 N264 N250 VDD VSS N235 TL082  ; pins In+ In- V+ V- OUT
C141 in36 N265 {C_val}
R212 N265 N293 {R1_val}
R213 N293 N266 {R2_val}
R214 N266 N307 {R3_val}
C142 N307 0 {C_val}
C143 out36 N267 {C_val}
R215 N267 N294 {R4_val}
R216 N294 N268 {R5_val}
R217 N268 N308 {R6_val}
C144 N308 0 {C_val}
Rn36 out36 in36 R=Rn(36,V(in36,out36))
X§U141 in36 N293 VDD VSS N266 TL082  ; pins In+ In- V+ V- OUT
X§U142 N307 N293 VDD VSS N265 TL082  ; pins In+ In- V+ V- OUT
X§U143 out36 N294 VDD VSS N268 TL082  ; pins In+ In- V+ V- OUT
X§U144 N308 N294 VDD VSS N267 TL082  ; pins In+ In- V+ V- OUT
C145 in37 N269 {C_val}
R218 N269 N295 {R1_val}
R219 N295 N270 {R2_val}
R220 N270 N309 {R3_val}
C146 N309 0 {C_val}
C147 out37 N271 {C_val}
R221 N271 N296 {R4_val}
R222 N296 N272 {R5_val}
R223 N272 N310 {R6_val}
C148 N310 0 {C_val}
Rn37 out37 in37 R=Rn(37,V(in37,out37))
X§U145 in37 N295 VDD VSS N270 TL082  ; pins In+ In- V+ V- OUT
X§U146 N309 N295 VDD VSS N269 TL082  ; pins In+ In- V+ V- OUT
X§U147 out37 N296 VDD VSS N272 TL082  ; pins In+ In- V+ V- OUT
X§U148 N310 N296 VDD VSS N271 TL082  ; pins In+ In- V+ V- OUT
C149 in38 N273 {C_val}
R224 N273 N297 {R1_val}
R225 N297 N274 {R2_val}
R226 N274 N311 {R3_val}
C150 N311 0 {C_val}
C151 out38 N275 {C_val}
R227 N275 N298 {R4_val}
R228 N298 N276 {R5_val}
R229 N276 N312 {R6_val}
C152 N312 0 {C_val}
Rn38 out38 in38 R=Rn(38,V(in38,out38))
X§U149 in38 N297 VDD VSS N274 TL082  ; pins In+ In- V+ V- OUT
X§U150 N311 N297 VDD VSS N273 TL082  ; pins In+ In- V+ V- OUT
X§U151 out38 N298 VDD VSS N276 TL082  ; pins In+ In- V+ V- OUT
X§U152 N312 N298 VDD VSS N275 TL082  ; pins In+ In- V+ V- OUT
C153 in39 N277 {C_val}
R230 N277 N299 {R1_val}
R231 N299 N278 {R2_val}
R232 N278 N313 {R3_val}
C154 N313 0 {C_val}
C155 out39 N279 {C_val}
R233 N279 N300 {R4_val}
R234 N300 N280 {R5_val}
R235 N280 N314 {R6_val}
C156 N314 0 {C_val}
Rn39 out39 in39 R=Rn(39,V(in39,out39))
X§U153 in39 N299 VDD VSS N278 TL082  ; pins In+ In- V+ V- OUT
X§U154 N313 N299 VDD VSS N277 TL082  ; pins In+ In- V+ V- OUT
X§U155 out39 N300 VDD VSS N280 TL082  ; pins In+ In- V+ V- OUT
X§U156 N314 N300 VDD VSS N279 TL082  ; pins In+ In- V+ V- OUT
C157 in40 N281 {C_val}
R236 N281 N301 {R1_val}
R237 N301 N282 {R2_val}
R238 N282 N315 {R3_val}
C158 N315 0 {C_val}
C159 out40 N283 {C_val}
R239 N283 N302 {R4_val}
R240 N302 N284 {R5_val}
R241 N284 N316 {R6_val}
C160 N316 0 {C_val}
Rn40 out40 in40 R=Rn(40,V(in40,out40))
X§U157 in40 N301 VDD VSS N282 TL082  ; pins In+ In- V+ V- OUT
X§U158 N315 N301 VDD VSS N281 TL082  ; pins In+ In- V+ V- OUT
X§U159 out40 N302 VDD VSS N284 TL082  ; pins In+ In- V+ V- OUT
X§U160 N316 N302 VDD VSS N283 TL082  ; pins In+ In- V+ V- OUT
C161 in41 N285 {C_val}
R242 N285 N303 {R1_val}
R243 N303 N286 {R2_val}
R244 N286 N317 {R3_val}
C162 N317 0 {C_val}
C163 out41 N287 {C_val}
R245 N287 N304 {R4_val}
R246 N304 N288 {R5_val}
R247 N288 N318 {R6_val}
C164 N318 0 {C_val}
Rn41 out41 in41 R=Rn(41,V(in41,out41))
X§U161 in41 N303 VDD VSS N286 TL082  ; pins In+ In- V+ V- OUT
X§U162 N317 N303 VDD VSS N285 TL082  ; pins In+ In- V+ V- OUT
X§U163 out41 N304 VDD VSS N288 TL082  ; pins In+ In- V+ V- OUT
X§U164 N318 N304 VDD VSS N287 TL082  ; pins In+ In- V+ V- OUT
C165 in42 N289 {C_val}
R248 N289 N305 {R1_val}
R249 N305 N290 {R2_val}
R250 N290 N319 {R3_val}
C166 N319 0 {C_val}
C167 out42 N291 {C_val}
R251 N291 N306 {R4_val}
R252 N306 N292 {R5_val}
R253 N292 N320 {R6_val}
C168 N320 0 {C_val}
Rn42 out42 in42 R=Rn(42,V(in42,out42))
X§U165 in42 N305 VDD VSS N290 TL082  ; pins In+ In- V+ V- OUT
X§U166 N319 N305 VDD VSS N289 TL082  ; pins In+ In- V+ V- OUT
X§U167 out42 N306 VDD VSS N292 TL082  ; pins In+ In- V+ V- OUT
X§U168 N320 N306 VDD VSS N291 TL082  ; pins In+ In- V+ V- OUT
C173 in44 N321 {C_val}
R260 N321 N341 {R1_val}
R261 N341 N322 {R2_val}
R262 N322 N351 {R3_val}
C174 N351 0 {C_val}
C175 out44 N323 {C_val}
R263 N323 N342 {R4_val}
R264 N342 N324 {R5_val}
R265 N324 N352 {R6_val}
C176 N352 0 {C_val}
Rn44 out44 in44 R=Rn(44,V(in44,out44))
X§U173 in44 N341 VDD VSS N322 TL082  ; pins In+ In- V+ V- OUT
X§U174 N351 N341 VDD VSS N321 TL082  ; pins In+ In- V+ V- OUT
X§U175 out44 N342 VDD VSS N324 TL082  ; pins In+ In- V+ V- OUT
X§U176 N352 N342 VDD VSS N323 TL082  ; pins In+ In- V+ V- OUT
C177 in45 N325 {C_val}
R266 N325 N343 {R1_val}
R267 N343 N326 {R2_val}
R268 N326 N353 {R3_val}
C178 N353 0 {C_val}
C179 out45 N327 {C_val}
R269 N327 N344 {R4_val}
R270 N344 N328 {R5_val}
R271 N328 N354 {R6_val}
C180 N354 0 {C_val}
Rn45 out45 in45 R=Rn(45,V(in45,out45))
X§U177 in45 N343 VDD VSS N326 TL082  ; pins In+ In- V+ V- OUT
X§U178 N353 N343 VDD VSS N325 TL082  ; pins In+ In- V+ V- OUT
X§U179 out45 N344 VDD VSS N328 TL082  ; pins In+ In- V+ V- OUT
X§U180 N354 N344 VDD VSS N327 TL082  ; pins In+ In- V+ V- OUT
C181 in46 N329 {C_val}
R272 N329 N345 {R1_val}
R273 N345 N330 {R2_val}
R274 N330 N355 {R3_val}
C182 N355 0 {C_val}
C183 out46 N331 {C_val}
R275 N331 N346 {R4_val}
R276 N346 N332 {R5_val}
R277 N332 N356 {R6_val}
C184 N356 0 {C_val}
Rn46 out46 in46 R=Rn(46,V(in46,out46))
X§U181 in46 N345 VDD VSS N330 TL082  ; pins In+ In- V+ V- OUT
X§U182 N355 N345 VDD VSS N329 TL082  ; pins In+ In- V+ V- OUT
X§U183 out46 N346 VDD VSS N332 TL082  ; pins In+ In- V+ V- OUT
X§U184 N356 N346 VDD VSS N331 TL082  ; pins In+ In- V+ V- OUT
C185 in47 N333 {C_val}
R278 N333 N347 {R1_val}
R279 N347 N334 {R2_val}
R280 N334 N357 {R3_val}
C186 N357 0 {C_val}
C187 out47 N335 {C_val}
R281 N335 N348 {R4_val}
R282 N348 N336 {R5_val}
R283 N336 N358 {R6_val}
C188 N358 0 {C_val}
Rn47 out47 in47 R=Rn(47,V(in47,out47))
X§U185 in47 N347 VDD VSS N334 TL082  ; pins In+ In- V+ V- OUT
X§U186 N357 N347 VDD VSS N333 TL082  ; pins In+ In- V+ V- OUT
X§U187 out47 N348 VDD VSS N336 TL082  ; pins In+ In- V+ V- OUT
X§U188 N358 N348 VDD VSS N335 TL082  ; pins In+ In- V+ V- OUT
C189 in48 N337 {C_val}
R284 N337 N349 {R1_val}
R285 N349 N338 {R2_val}
R286 N338 N359 {R3_val}
C190 N359 0 {C_val}
C191 out48 N339 {C_val}
R287 N339 N350 {R4_val}
R288 N350 N340 {R5_val}
R289 N340 N360 {R6_val}
C192 N360 0 {C_val}
Rn48 out48 in48 R=Rn(48,V(in48,out48))
X§U189 in48 N349 VDD VSS N338 TL082  ; pins In+ In- V+ V- OUT
X§U190 N359 N349 VDD VSS N337 TL082  ; pins In+ In- V+ V- OUT
X§U191 out48 N350 VDD VSS N340 TL082  ; pins In+ In- V+ V- OUT
X§U192 N360 N350 VDD VSS N339 TL082  ; pins In+ In- V+ V- OUT
* .ac oct 100 10 100
.tran 0 3 0 0.1m uic
.options plotwinsize=0
.save V(out22) V(out28)
.param C_val = 2.2n
.param R1_val = 15k
.param R2_val = 100
.param R3_val = 18k
.param R4_val = 7.15k
.param R5_val = 10
.param R6_val = 10.2k
.param Rc1_val = 137497
.param Rc2_val = 143966
.param Rc3_val = 335378
.param Rc4_val = 359197
.param Rc5_val = 136507
.param Rc6_val = 133844
.param Rc7_val = 162935
.param Rc8_val = 175687
.param Rc9_val = 308983
.param Rc10_val = 1637130
.param Rc11_val = 199764
.param Rc12_val = 209458
.param Rc13_val = 195817
.param Rc14_val = 181751
.param Rc15_val = 177058
.param Rc16_val = 197337
.param Rc17_val = 804733
.param Rc18_val = 230991
.param Rc19_val = 403874
.param Rc20_val = 119511
.param Rc21_val = 162180
.param Rc22_val = 151987
.param Rc23_val = 169750
.param Rc24_val = 963517
.param Rc25_val = 221460
.param Rc26_val = 225924
.param Rc27_val = 264416
.param Rc28_val = 145208
.param Rc29_val = 269598
.param Rc30_val = 163356
.param Rc31_val = 331548
.param Rc32_val = 152618
.param Rc33_val = 365222
.param Rc34_val = 660544
.param Rc35_val = 198092
.param Rc36_val = 242109
.param Rc37_val = 307092
.param Rc38_val = 226439
.param Rc39_val = 243306
.param Rc40_val = 342655
.param Rc41_val = 1277490
.param Rc42_val = 195684
.param Rc43_val = 180198
.param Rc44_val = 235483
.param Rc45_val = 387376
.param Rc46_val = 178926
.param Rc47_val = 192781
.param Rc48_val = 232265
.param Rc49_val = 130807
.param Rc50_val = 108829
.param Rc51_val = 102858
.param Rc52_val = 163610
.param Rc53_val = 210512
.param Rc54_val = 327857
.param Rc55_val = 182862
.param Rc56_val = 248761
.param Rc57_val = 158351
.param Rc58_val = 290809
.param Rc59_val = 112916
.param Rc60_val = 202619
.param Rc61_val = 248560
.param Rc62_val = 248607
.param Rc63_val = 229609
.param Rc64_val = 157225
.param Rc65_val = 217680
.param Rc66_val = 148230
.param Rc67_val = 292489
.param Rc68_val = 268847
.param Rc69_val = 218977
.param Rc70_val = 141764
.param Rc71_val = 177356
.param Rc72_val = 208345
.param Rc73_val = 195446
.param Rc74_val = 189083
.param Rc75_val = 240477
.param Rc76_val = 329125
.param Rc77_val = 386455
.param Rc78_val = 468765
.param Rc79_val = 200665
.param Rc80_val = 287325
.param Rc81_val = 237342
.param Rc82_val = 265102
.param Rc83_val = 342203
.param Rc84_val = 311039
.func Gcoef(n) {table(n,
+ 2,  0.00416354,
+ 3,  0.00459134,
+ 4,  0.00858677,
+ 5,  0.00514080,
+ 6,  0.00610253,
+ 8,  0.00253857,
+ 9,  0.00354810,
+ 10, 0.00218956,
+ 11, 0.00532946,
+ 12, 0.00160927,
+ 13, 0.00230666,
+ 14, 0.00436042,
+ 15, 0.00661917,
+ 16, 0.00625554,
+ 17, 0.00270613,
+ 18, 0.00242276,
+ 19, 0.00573885,
+ 20, 0.00920071,
+ 21, 0.00141225,
+ 22, 0.00353442,
+ 23, 0.00173459,
+ 24, 0.00452449,
+ 25, 0.00380781,
+ 26, 0.00439520,
+ 27, 0.00582949,
+ 28, 0.00481257,
+ 29, 0.00444160,
+ 30, 0.00286494,
+ 31, 0.00570677,
+ 32, 0.00593731,
+ 33, 0.00353223,
+ 34, 0.00179884,
+ 35, 0.00396171,
+ 36, 0.00581627,
+ 37, 0.00434899,
+ 38, 0.00313810,
+ 39, 0.00752660,
+ 40, 0.00481745,
+ 41, 0.00311895,
+ 42, 0.000371861,
+ 44, 0.00410260,
+ 45, 0.00258752,
+ 46, 0.00289991,
+ 47, 0.00331924,
+ 48, 0.00131016)}
.func Rn(n,v) {1k/(Gcoef(n)+2e-4*v*v)}
.option method=gear
.inc "models/TL082.lib"
.backanno
.end